# Altium schematic sheet Controller_Sheet.SchDoc
size A4; SheetNumber: 4; SheetTotal: 6
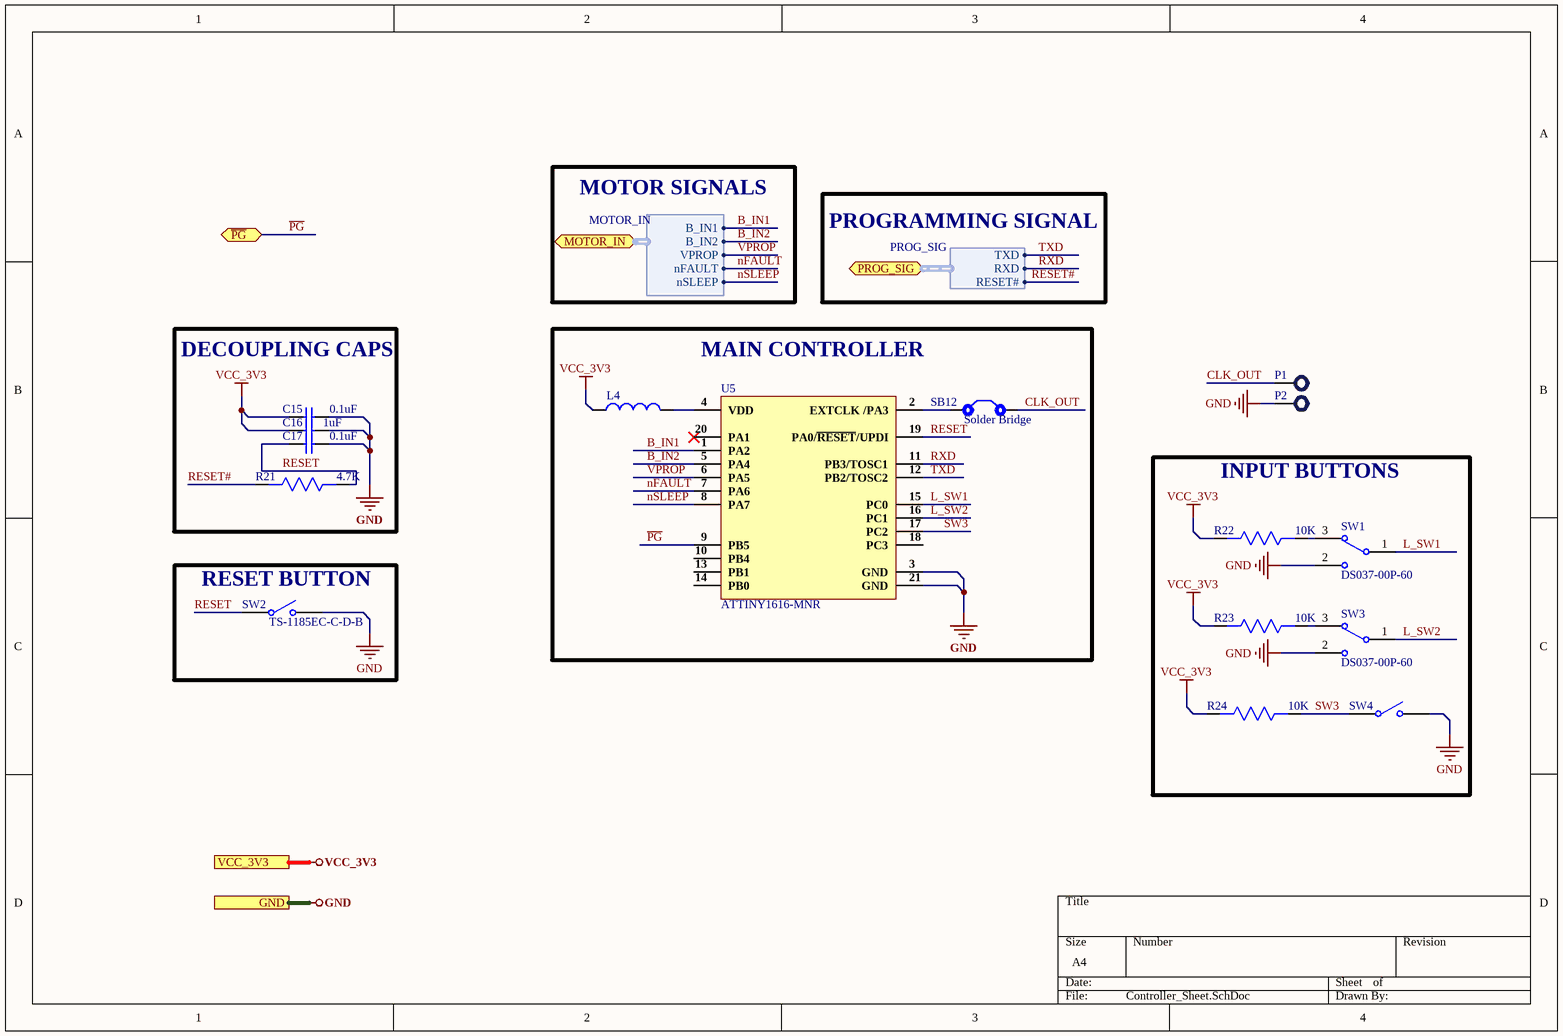
[diagram p0: Controller_Sheet.SchDoc]

## Parts
C15  0.1uF  [Cap 0402]
C16  1uF  [Cap 0402]
C17  0.1uF  [Cap 0402]
L4  MMZ0603S601CT000  [IND 0201]  (value not drawn)
P1  TEST POINT  [TEST POINT]  (value not drawn)
P2  TEST POINT  [TEST POINT]  (value not drawn)
R21  4.7K  [Res0402]
R22  10K  [Res0402]
R23  10K  [Res0402]
R24  10K  [Res0402]
SB12  Solder Bridge  [Solder Bridge]
SW1  DS037-00P-60  [DS037-00P-60]
SW2  TS-1185EC-C-D-B  [TS-1185EC-C-D-B]
SW3  DS037-00P-60  [DS037-00P-60]
SW4  TS-1185EC-C-D-B  [TS-1185EC-C-D-B]  (value not drawn)
U5  ATTINY1616-MNR  [20-QFN]

## Blocks framed on the sheet
DECOUPLING CAPS: C15-C17 R21
MAIN CONTROLLER: L4 SB12 U5
INPUT BUTTONS: R22-R24 SW1 SW3 SW4
RESET BUTTON: SW2

## Ports
GND, MOTOR_IN (bidir, harness MOTOR_IN), PROG_SIG (bidir, harness PROG_SIG), VCC_3V3, ~{PG} (bidir)

## Harnesses
MOTOR_IN: B_IN1, B_IN2, VPROP, nFAULT, nSLEEP
PROG_SIG: TXD, RXD, RESET#

## Nets
GND: C15.2 C16.2 C17.2 P2.1 SW1.2 SW2.2 SW3.2 SW4.2 U5.3(GND) U5.21(GND) ; port GND
VCC_3V3: C15.1 C16.1 L4.1 R22.2 R23.2 R24.2 ; port VCC_3V3
~{PG}: U5.9(PB5) ; port ~{PG}
B_IN1: U5.1(PA2) ; port MOTOR_IN.B_IN1
B_IN2: U5.5(PA4) ; port MOTOR_IN.B_IN2
CLK_OUT: P1.1 SB12.2
L_SW1: SW1.1 U5.15(PC0)
L_SW2: SW3.1 U5.16(PC1)
nFAULT: U5.7(PA6) ; port MOTOR_IN.nFAULT
nSLEEP: U5.8(PA7) ; port MOTOR_IN.nSLEEP
RESET: C17.1 R21.1 SW2.1 U5.19(PA0/~{RESET}/UPDI)
RESET#: R21.2 ; port PROG_SIG.RESET#
RXD: U5.11(PB3/TOSC1) ; port PROG_SIG.RXD
SW3: R24.1 SW4.1 U5.17(PC2)
TXD: U5.12(PB2/TOSC2) ; port PROG_SIG.TXD
VPROP: U5.6(PA5) ; port MOTOR_IN.VPROP
NetL4_2: L4.2 U5.4(VDD)
NetR22_1: R22.1 SW1.3
NetR23_1: R23.1 SW3.3
NetSB12_1: SB12.1 U5.2(EXTCLK_/PA3)

Not connected (* = marked no-connect by the designer): U5 10(PB4) 13(PB1) 14(PB0) 18(PC3) 20(PA1)*

## Notes on the sheet
- MOTOR SIGNALS
- PROGRAMMING SIGNAL

## Library data of the parts
C15 C17 = CC0402KRX7R7BB104: CAP CER 0.1UF 16V X7R 0402; Manufacturer: Yageo; Tolerance: 10%; Capacitance: 100nF; Supplier 1: Digi-Key; Manufacturer Part Number: CC0402KRX7R7BB104; Stock 1: 16982736; Pricing 1: 1=0.1, 10=0.034, 100=0.015, 500=0.0107, 1000=0.00841, 2500=0.00764, 5000=0.00703 (USD); Mount: Surface Mount; Case/Package: 0402; Number of Pins: 2; Case Code (Metric): 1005; Case Code (Imperial): 0402; Min Operating Temperature: -55°C; Max Operating Temperature: 125°C; Dielectric: X7R; Voltage Rating: 16V; Voltage Rating (DC): 16V; Packaging: Tape and Reel; Package Quantity: 1; Termination: SMD/SMT; Composition: Ceramic; Voltage: 16V; Length: 1mm; Height: 0.5mm; Width: 0.02inch; Thickness: 0.022inch; Depth: 0.5mm; Radiation Hardening: No; REACH SVHC: No SVHC; Lead Free: Lead Free; Halogen Free: Halogen Free; ComponentLink1URL: http://www.yageo.com/documents/recent/UPY-GPHC_X7R_6.3V-to-50V_8.pdf?src-supplier=Avnet+Europe; ComponentLink1Description: http://www.yageo.com/documents/recent/UPY-GPHC_X7R_6.3V-to-50V_8.pdf?src-supplier=Avnet+Europe; ComponentLink2URL: http://www.yageo.com/documents/recent/UPY-GPHC_X7R_6.3V-to-50V_18.pdf?src-supplier=Digi-Key; ComponentLink2Description: http://www.yageo.com/documents/recent/UPY-GPHC_X7R_6.3V-to-50V_18.pdf?src-supplier=Digi-Key; ComponentLink3URL: http://www.yageo.com/documents/recent/UPY-GPHC_X7R_6.3V-to-50V_8.pdf?src-supplier=Avnet; ComponentLink3Description: http://www.yageo.com/documents/recent/UPY-GPHC_X7R_6.3V-to-50V_8.pdf?src-supplier=Avnet; ComponentLink4URL: http://www.yageo.com/documents/recent/UPY-GPHC_X7R_6.3V-to-50V_18.pdf?src-supplier=Mouser; ComponentLink4Description: http://www.yageo.com/documents/recent/UPY-GPHC_X7R_6.3V-to-50V_18.pdf?src-supplier=Mouser; ComponentLink5URL: http://www.farnell.com/datasheets/2167236.pdf?src-supplier=Element14; ComponentLink5Description: http://www.farnell.com/datasheets/2167236.pdf?src-supplier=Element14; ComponentLink6URL: http://www.farnell.com/datasheets/1489800.pdf?src-supplier=Element14; ComponentLink6Description: http://www.farnell.com/datasheets/1489800.pdf?src-supplier=Element14; Supplier Part Number 1: 311-1338-1-ND
C16 = GRM155R61E105KA12D: CAP CER 1UF 25V X5R 0402; Manufacturer: Murata; Material: Ceramic; Tolerance: 10%; Supplier 1: Digi-Key; Manufacturer Part Number: GRM155R61E105KA12D; Stock 1: 1194305; Pricing 1: 1=0.11, 10=0.077, 100=0.0363, 500=0.02546, 1000=0.02108, 2500=0.01962, 5000=0.01795 (USD); Mount: Surface Mount; Case/Package: 0402; Weight: 0.000212oz; Case Code (Metric): 1005; Case Code (Imperial): 0402; Min Operating Temperature: -55°C; Max Operating Temperature: 85°C; Capacitance: 1uF; Voltage Rating: 25V; Packaging: Tape and Reel; Dielectric: X5R; Voltage: 25V; Termination: SMD/SMT; Voltage Rating (DC): 25V; Package Quantity: 10000; Length: 1mm; Height: 0.5mm; Width: 0.5mm; Thickness: 0.022inch; Depth: 0.5mm; REACH SVHC: No SVHC; Lead Free: Lead Free; ComponentLink1URL: http://www.farnell.com/datasheets/2048341.pdf?src-supplier=Element14; ComponentLink1Description: http://www.farnell.com/datasheets/2048341.pdf?src-supplier=Element14; Supplier Part Number 1: 490-10017-1-ND
L4 = MMZ0603S601CT000: FERRITE BEAD 600 OHM 0201 1LN; Manufacturer: TDK; Impedance: 600R; Tolerance: 25%; DC Resistance (DCR): 1.45R; Max DC Current: 100mA; Supplier 1: Digi-Key; Manufacturer Part Number: MMZ0603S601CT000; RoHS: Yes; Category: Inductors; Stock 1: 1540; Pricing 1: 1=0.12000, 10=0.09900, 25=0.07680, 50=0.06380, 100=0.05500, 250=0.04400, 500=0.03960, 1000=0.03300, 5000=0.03080 (USD); Mount: Surface Mount; Case/Package: 0201; Core Material: Ferrite; Case Code (Metric): 0603; Case Code (Imperial): 0201; Packaging: Cut Tape; Package Quantity: 15000; Current Rating: 100mA; Length: 0.024inch; Width: 0.012inch; Height: 0.013inch; REACH SVHC: No SVHC; Lead Free: Lead Free; RoHS Compliant: Yes; ComponentLink1URL: https://datasheet.ciiva.com/46381/1795294-46381669.pdf?src-supplier=Element14; ComponentLink1Description: https://datasheet.ciiva.com/46381/1795294-46381669.pdf?src-supplier=Element14; ComponentLink2URL: https://datasheet.ciiva.com/46634/beads-commercial-signal-mmz-en-46634390.pdf?src-supplier=Digi-Key; ComponentLink2Description: https://datasheet.ciiva.com/46634/beads-commercial-signal-mmz-en-46634390.pdf?src-supplier=Digi-Key; ComponentLink3URL: https://datasheet.ciiva.com/48682/beads-commercial-signal-mmz-en-48682603.pdf?src-supplier=Avnet; ComponentLink3Description: https://datasheet.ciiva.com/48682/beads-commercial-signal-mmz-en-48682603.pdf?src-supplier=Avnet; ComponentLink4URL: https://datasheet.ciiva.com/46634/beads-commercial-signal-mmz-en-46634381.pdf?src-supplier=Digi-Key; ComponentLink4Description: https://datasheet.ciiva.com/46634/beads-commercial-signal-mmz-en-46634381.pdf?src-supplier=Digi-Key; Supplier Part Number 1: 445-2146-1-ND
P1 P2 = TEST POINT: Test Point ON
R21 = CR0402JF0472G: 4.7K ±5% 1/16W ±200ppm/°C 0402 Chip Resistor - Surface Mount RoHS; Manufacturer: LIZ Elec; Manufacturer Part No: CR0402JF0472G; Package: 0402; Value: 4.7K
R22-R24 = RK73B1ETTP103J: RES 10K OHM 5% 1/10W 0402; Manufacturer: KOA Speer; Resistance: 10kR; Power Rating: 63mW; Voltage Rating: 50V; Temperature Coefficient: 200ppm/°C; Supplier 1: Digi-Key; Manufacturer Part Number: RK73B1ETTP103J; Stock 1: 2917894; Pricing 1: 1=0.1, 10=0.016, 100=0.0065, 1000=0.00292, 2500=0.00253, 5000=0.00209 (USD); Mount: Surface Mount; Case/Package: 0402; Case Code (Imperial): 0402; Case Code (Metric): 1005; Min Operating Temperature: -55°C; Max Operating Temperature: 155°C; Packaging: Tape and Reel; Tolerance: 5%; Package Quantity: 10000; Composition: Thick Film; Termination: SMD/SMT; Military Standard: Not; Voltage Rating (DC): 50V; Length: 1mm; Height: 0.35mm; Width: 0.5mm; Depth: 0.5mm; Lead Free: Lead Free; ComponentLink1URL: https://www.verical.com/server-webapp/html/getDatasheet?partID=89073&src-supplier=Verical; ComponentLink1Description: https://www.verical.com/server-webapp/html/getDatasheet?partID=89073&src-supplier=Verical; Supplier Part Number 1: 2019-RK73B1ETTP103JCT-ND
SB12 = Solder Bridge: Solder Bridge ON
SW1 SW3 = DS037-00P-60: 8.2mm 300mA 2.7mm 6V SPDT Micro Switch -25℃~+85℃ PCPin 9.9mm 100000 Plugin Microswitches ROHS; Manufacturer: XKB Connectivity; Manufacturer Part num:: DS037-00P-60; Footprint: Custom
SW2 SW4 = TS-1185EC-C-D-B: 3mm 2mm Round Button 50mA Top3.65mm SPST 12V SMD Tactile Switches; Manufacturer: XKB; Manufacturer Part No: TS-1185EC-C-D-B; Package: Custom; ComponentLink1Description: LCSC; ComponentLink1URL: https://lcsc.com/product-detail/Tactile-Switches_XKB-Connectivity-TS-1185EC-C-D-B_C318893.html
U5 = ATTINY1616-MNR: IC MCU 8BIT 16KB FLASH 20VQFN; Manufacturer: Microchip; Interface: I2C,SPI,IrDA,UART,USART; Peripherals: Brown-out Detect/Reset,POR,PWM,WDT; Core Architecture: AVR; Frequency: 20MHz; Number of I/Os: 18; Oscillator Type: Internal; Supplier 1: Digi-Key; Manufacturer Part Number: ATTINY1616-MNR; RoHS: No; Category: Microcontrollers; Stock 1: 3963; Pricing 1: 1=0.75000, 25=0.69000, 100=0.62000 (USD); Case/Package: VQFN; Min Operating Temperature: -40°C; Max Operating Temperature: 105°C; Memory Type: FLASH; Packaging: Cut Tape; Memory Size: 16KB; ComponentLink1URL: http://www.microchip.com/mymicrochip/filehandler.aspx?ddocname=en606269&src-supplier=Digi-Key; ComponentLink1Description: http://www.microchip.com/mymicrochip/filehandler.aspx?ddocname=en606269&src-supplier=Digi-Key; Supplier Part Number 1: ATTINY1616-MNRCT-ND